# EasyEDA Pro project travellium-12v-desktop-power-supply-cc8d8467.epro, schematic MK9218_double
Board Name: MK9218_double; Create Date: 2025-01-31; Page Name: MK9218_double_SCH; Project Name: 12V桌面电源; Schematic Name: MK9218_double; Update Date: 2025-01-31; Company: 嘉立创EDA; Page Size: A4; Version: V1.0
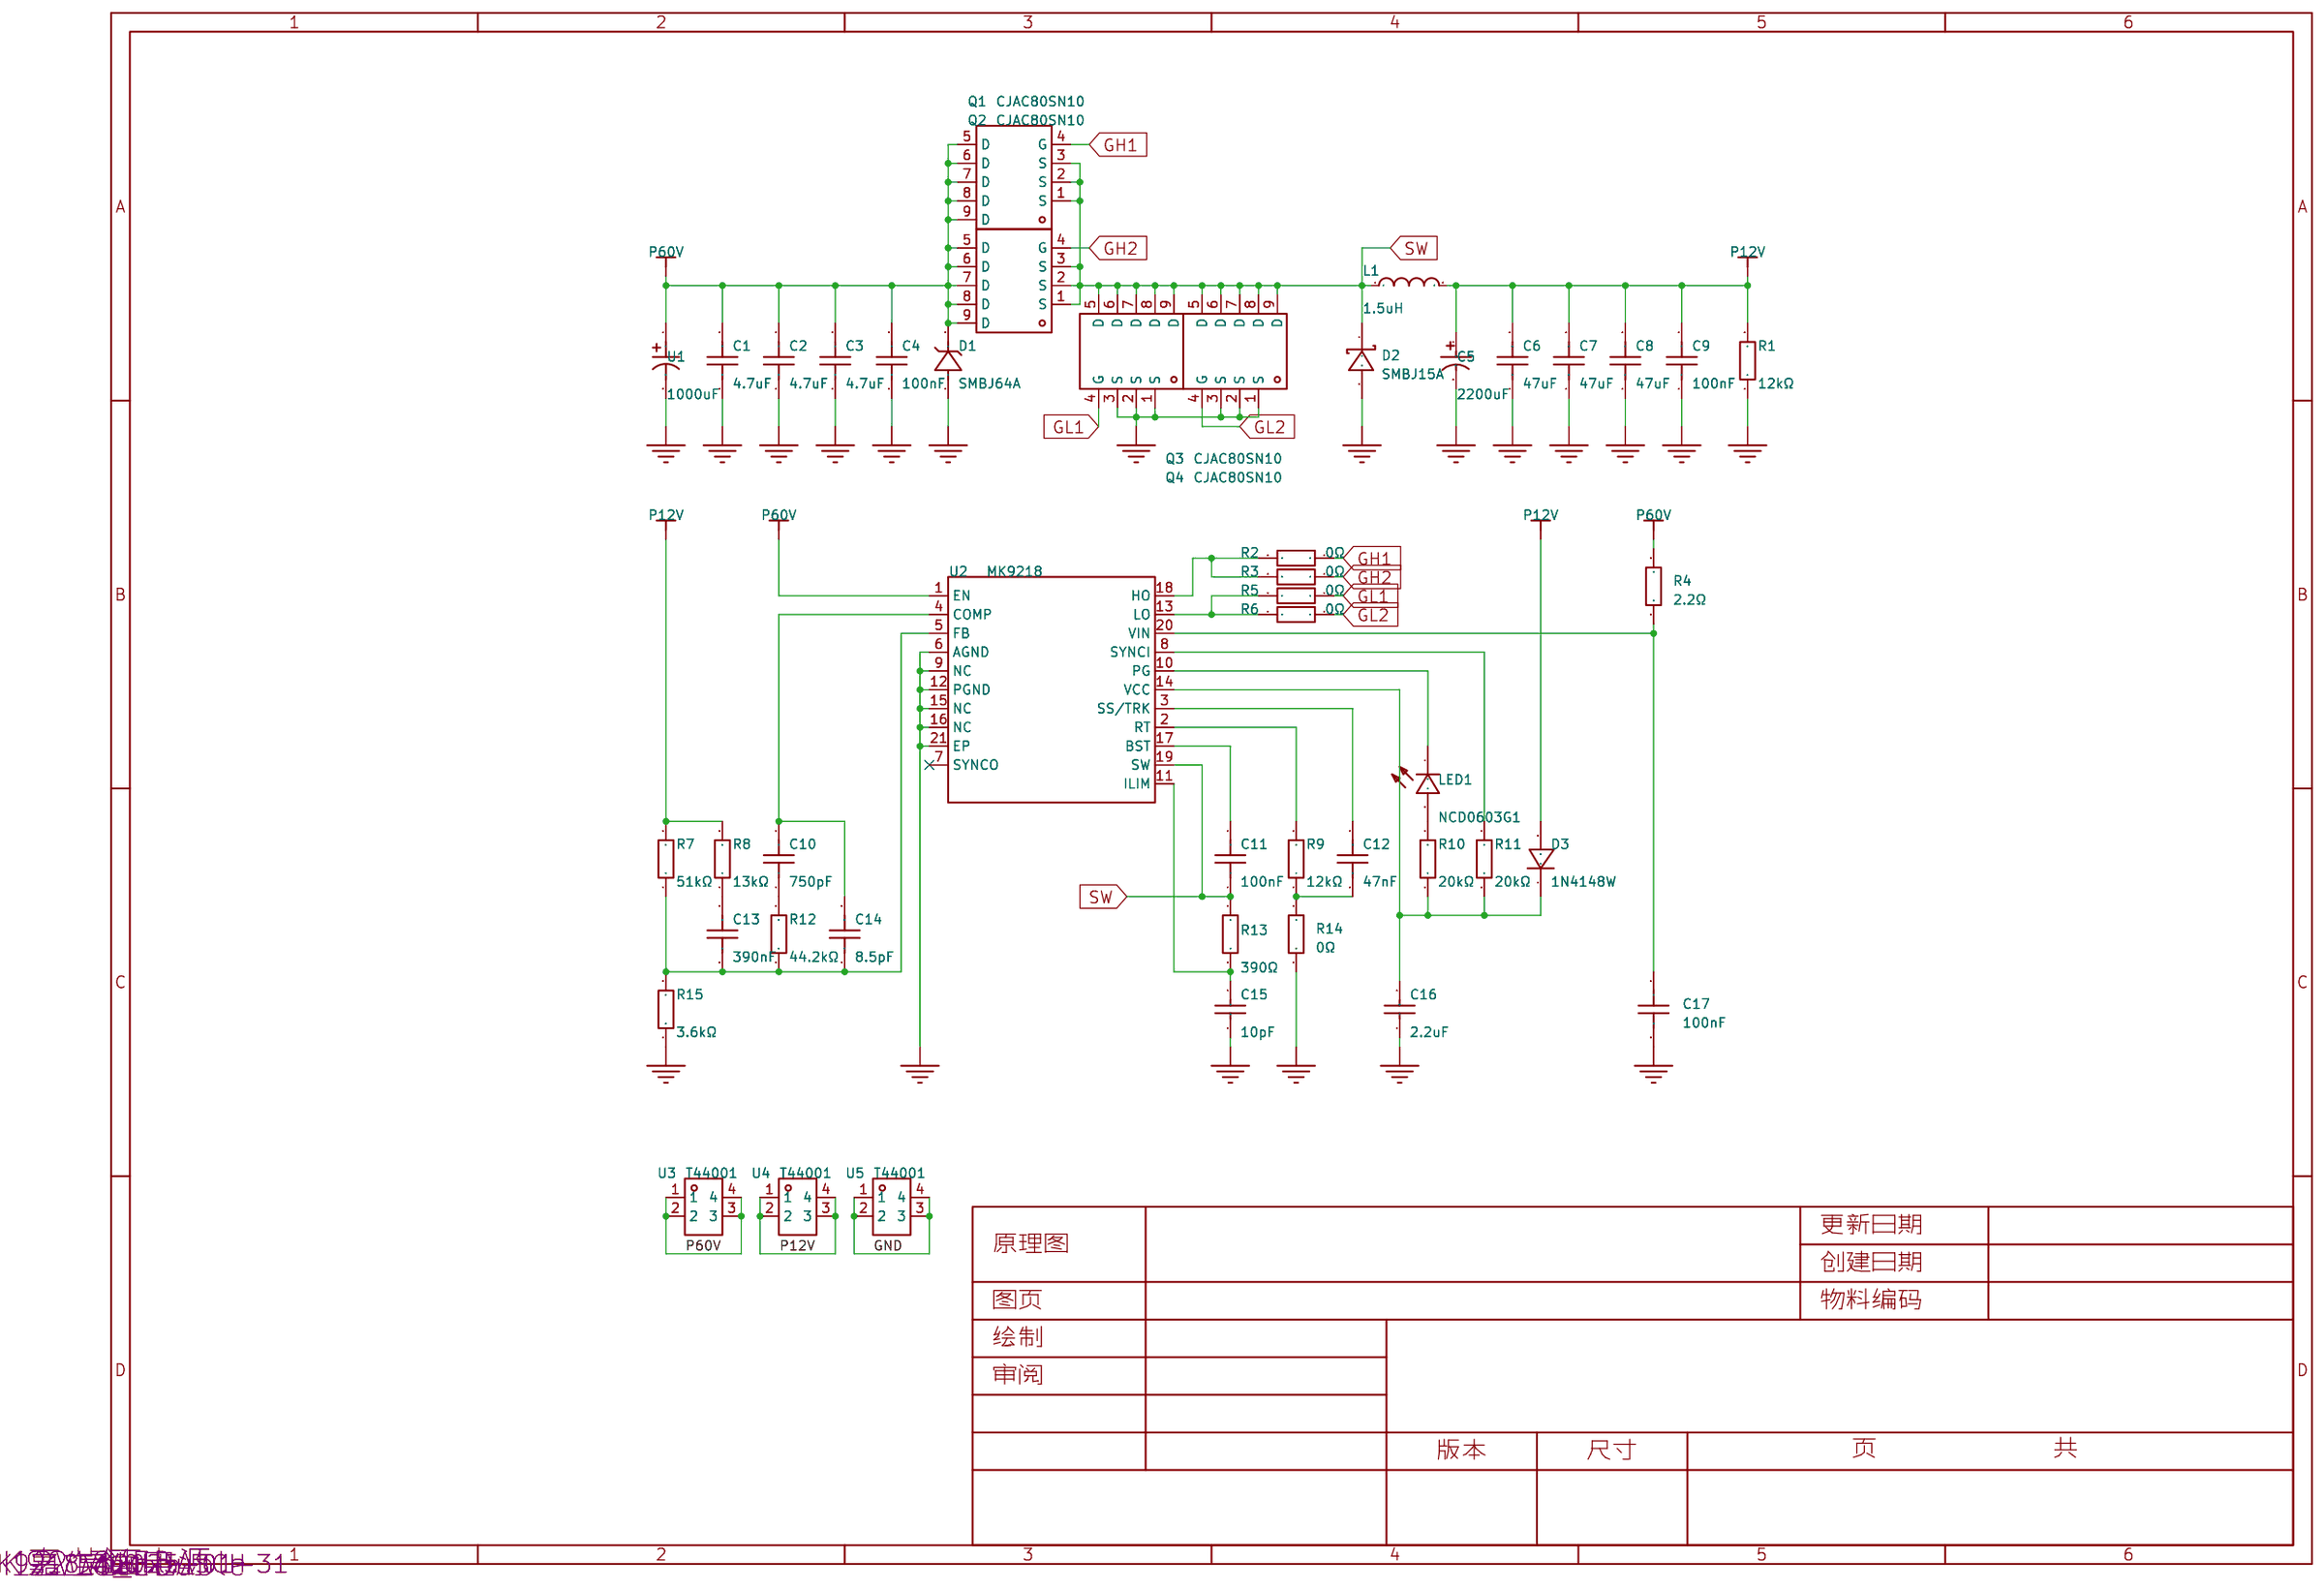
[diagram p5: schematic sheet]

## Parts
C1  4.7uF  [C1210]
C2  4.7uF  [C1210]
C3  4.7uF  [C1210]
C4  100nF  [C0603]
C5  2200uF  [CAP-TH_BD13.0-P5.00-D1.2-FD]
C6  47uF  [C1210]
C7  47uF  [C1210]
C8  47uF  [C1210]
C9  100nF  [C0603]
C10  750pF  [C0603]
C11  100nF  [C0603]
C12  47nF  [C0603]
C13  390nF  [C0603]
C14  8.5pF  [C0603]
C15  10pF  [C0603]
C16  2.2uF  [C0603]
C17  100nF  [C0603]
D1  SMBJ64A  [SMB_L4.4-W3.6-LS5.3-L-FD]
D2  SMBJ15A  [SMB_L4.6-W3.6-LS5.3-RD]
D3  1N4148W  [SOD-123_L2.8-W1.8-LS3.7-RD]
L1  1.5uH  [IND-SMD_L17.5-W17.5]
LED1  NCD0603G1  [LED0603-RD_1]
Q1  CJAC80SN10  [PDFN-8_L5.8-W5.0-P1.27-LS6.0-BL]
Q2  CJAC80SN10  [PDFN-8_L5.8-W5.0-P1.27-LS6.0-BL]
Q3  CJAC80SN10  [PDFN-8_L5.8-W5.0-P1.27-LS6.0-BL]
Q4  CJAC80SN10  [PDFN-8_L5.8-W5.0-P1.27-LS6.0-BL]
R1  12kΩ  [R0603]
R2  0Ω  [R0603]
R3  0Ω  [R0603]
R4  2.2Ω  [R0603]
R5  0Ω  [R0603]
R6  0Ω  [R0603]
R7  51kΩ  [R0603]
R8  13kΩ  [R0603]
R9  12kΩ  [R0603]
R10  20kΩ  [R0603]
R11  20kΩ  [R0603]
R12  44.2kΩ  [R0603]
R13  390Ω  [R0603]
R14  0Ω  [R0603]
R15  3.6kΩ  [R0603]
U1  1000uF  [CAP-TH_BD18.0-P7.50-D1.2-FD]
U2  MK9218  [VQFN-20_L4.5-W3.5-P0.50-BL-EP_TI_RHL0020A]  (no BOM)
U3  T44001  [CONN-TH_T44001]
U4  T44001  [CONN-TH_T44001]
U5  T44001  [CONN-TH_T44001]

## Library data of the parts
C1-C3 = 1210B475K101NT: 容值:4.7uF;精度:±10%;额定电压:100V;材质(温度系数):X7R;; LCSC Part Name: 4.7uF ±10% 100V; Supplier Part: C2840282; Manufacturer: FH(风华); Supplier Footprint: 1210; JLCPCB Part Class: 扩展库; Datasheet: https://atta.szlcsc.com/upload/public/pdf/source/20210617/C2840282_5B7AB5BFD77495008CFAB3FC2796A0E9.pdf; Supplier: LCSC; Tolerance: ±10%; Voltage Rated: 100V; Temperature Coefficient: X7R
C4 C9 C11 C17 = 0603B104K101NT: 容值:100nF;精度:±10%;额定电压:100V;材质(温度系数):X7R;; LCSC Part Name: 100nF ±10% 100V; Supplier Part: C88219; Manufacturer: FH(风华); Supplier Footprint: 0603; JLCPCB Part Class: Extended Part; Datasheet: https://atta.szlcsc.com/upload/public/pdf/source/20200305/C486355_26A10D38EF8C2A5C37091D0039909270.pdf; Supplier: LCSC; Tolerance: ±10%; Voltage Rated: 100V; Temperature Coefficient: X7R
C5 = EWH1EM222K20OT: 容值:2200uF;精度:±20%;额定电压:25V;纹波电流:-;等效串联电阻:-;; LCSC Part Name: 2200uF ±20% 25V; Supplier Part: C106733; Manufacturer: AISHI(艾华集团); Supplier Footprint: 插件,D13xL20mm; JLCPCB Part Class: 扩展库; Datasheet: https://atta.szlcsc.com/upload/public/pdf/source/20200106/C481308_16D735F9103482ADD8491C667D201AFA.pdf; Supplier: LCSC; Tolerance: ±20%; Rated Voltage: 25V; Lead Spacing: 5mm; φD: 13mm; L: 20mm; Lifetime @ Temp: 2000hrs@105℃
C6-C8 = HGC1210R5476M250NSVK: 容值:47uF;精度:±20%;额定电压:25V;材质(温度系数):X5R;; LCSC Part Name: 47uF ±20% 25V; Supplier Part: C7432791; Manufacturer: Chinocera(华瓷); Supplier Footprint: 1210; Datasheet: https://atta.szlcsc.com/upload/public/pdf/source/20240320/FAC3FEC40A78BC5CCCE96C232A94D860.pdf; Supplier: LCSC; Tolerance: ±20%; Voltage Rated: 25V; Temperature Coefficient: X5R
C10 = CC0603JRNPO9BN751: 容值:750pF;精度:±5%;额定电压:50V;材质(温度系数):NP0;; LCSC Part Name: 750pF ±5% 50V; Supplier Part: C113798; Manufacturer: YAGEO(国巨); Supplier Footprint: 0603; JLCPCB Part Class: 扩展库; Datasheet: https://atta.szlcsc.com/upload/public/pdf/source/20170914/C128857_1505359892143968080.pdf; Supplier: LCSC; Tolerance: ±5%; Voltage Rated: 50V; Temperature Coefficient: NP0
C12 = 0603B473K500NT: 容值:47nF;精度:±10%;额定电压:50V;材质(温度系数):X7R;; LCSC Part Name: 47nF ±10% 50V; Supplier Part: C285123; Manufacturer: FH(风华); Supplier Footprint: 0603; Datasheet: https://atta.szlcsc.com/upload/public/pdf/source/20200305/C486355_26A10D38EF8C2A5C37091D0039909270.pdf; Supplier: LCSC; Tolerance: ±10%; Voltage Rated: 50V; Temperature Coefficient: X7R
C13 = TCC0603X7R394K500CT: 容值:390nF;精度:±10%;额定电压:50V;材质(温度系数):X7R;; LCSC Part Name: 390nF ±10% 50V; Supplier Part: C376833; Manufacturer: CCTC(三环); Supplier Footprint: 0603; Datasheet: https://atta.szlcsc.com/upload/public/pdf/source/20191203/C466239_F62A586702D44EEA1C39B32FC8662B21.pdf; Supplier: LCSC; Tolerance: ±10%; Voltage Rated: 50V; Temperature Coefficient: X7R
C14 = 0603CG8R5C500NT: 容值:8.5pF;额定电压:50V;材质(温度系数):C0G;; LCSC Part Name: 8.5pF 50V; Supplier Part: C501848; Manufacturer: FH(风华); Supplier Footprint: 0603; Datasheet: https://atta.szlcsc.com/upload/public/pdf/source/20200305/C486355_26A10D38EF8C2A5C37091D0039909270.pdf; Supplier: LCSC; Voltage Rated: 50V; Temperature Coefficient: C0G
C15 = CC0603JRNPO9BN100: 容值:10pF;精度:±5%;额定电压:50V;材质(温度系数):NP0;; LCSC Part Name: 10pF ±5% 50V; Supplier Part: C106245; Manufacturer: YAGEO(国巨); Supplier Footprint: 0603; Datasheet: https://atta.szlcsc.com/upload/public/pdf/source/20170505/1493957838062.pdf; Supplier: LCSC; Tolerance: ±5%; Voltage Rated: 50V; Temperature Coefficient: NP0
C16 = 0603B225K250NT: 容值:2.2uF;精度:±10%;额定电压:25V;材质(温度系数):X7R;; LCSC Part Name: 2.2uF ±10% 25V; Supplier Part: C99228; Manufacturer: FH(风华); Supplier Footprint: 0603; JLCPCB Part Class: 扩展库; Datasheet: https://atta.szlcsc.com/upload/public/pdf/source/20200305/C486355_26A10D38EF8C2A5C37091D0039909270.pdf; Supplier: LCSC; Tolerance: ±10%; Voltage Rated: 25V; Temperature Coefficient: X7R
D1 = SMBJ64A_C19077594: 极性:单向;反向截止电压(Vrwm):64V;最大钳位电压:103V;峰值脉冲电流(Ipp):5.83A;峰值脉冲功率(Ppp):600W;击穿电压:78.6V;; Supplier Part: C19077594; Manufacturer: 宏迦橙; Supplier Footprint: SMB; Datasheet: https://atta.szlcsc.com/upload/public/pdf/source/20231129/482485C5E60BCB53F84D553F3B29D8A3.pdf; Supplier: LCSC; polarity: 单向; Reverse Stand-Off Voltage (Vrwm): 64V; Maximum Clamping Voltage: 103V; Peak Pulse Current (Ipp): 5.83A; Peak Pulse Power Dissipation (Ppp): 600W; Breakdown Voltage: 78.6V; Reverse Leakage Current (Ir): 5uA; Operating Temperature: -55℃~+155℃; Type: TVS
D2 = SMBJ15A_C188412: 反向截止电压(Vrwm):15V;最大钳位电压:24.4V;峰值脉冲电流(Ipp)@10/1000us:24.6A;峰值脉冲功率(Ppp)@10/1000us:600W;击穿电压:16.7V;; Supplier Part: C188412; Manufacturer: 晶导微电子; Supplier Footprint: SMB(DO-214AA); JLCPCB Part Class: 扩展库; Datasheet: https://atta.szlcsc.com/upload/public/pdf/source/20190425/C382838_2D6FAEBA99E8AAE51AD263CFC481B4D8.pdf; Supplier: LCSC; Reverse Stand-Off Voltage (Vrwm): 15V; Maximum Clamping Voltage: 24.4V; Peak Pulse Current (Ipp)@10/1000us: 24.6A; Peak Pulse Power Dissipation (Ppp)@10/1000us: 600W; Breakdown Voltage: 16.7V; Reverse Leakage Current (Ir): 1uA; Type: TVS
D3 = 1N4148W_C115103: 二极管配置:独立式;正向压降(Vf):1.25V@150mA;直流反向耐压(Vr):100V;平均整流电流(Io):300mA;功率:400mW;反向恢复时间(trr):8ns;; LCSC Part Name: 电压:100V 电流:300mA; Supplier Part: C115103; Manufacturer: 晶导微电子; Supplier Footprint: SOD-123; Datasheet: https://atta.szlcsc.com/upload/public/pdf/source/20170620/1497944800395.pdf; Supplier: LCSC; Diode Configuration: 独立式; Forward Voltage (Vf@If): 1.25V@150mA; Reverse Voltage (Vr): 100V; Average Rectified Current (Io): 300mA; Power Dissipation: 400mW; Reverse Leakage Current: 1uA@75V; Reverse Recovery Time (trr): 8ns; Operating Temperature: -55℃~+150℃@(Tj)
L1 = CKST1707-1.5uH/M: 电感值:1.5uH;精度:±20%;额定电流:35A;饱和电流(Isat):40A;类型:一体成型电感;; Manufacturer: CENKER(岑科); Supplier: LCSC; Supplier Part: C3002739; LCSC Part Name: 1.5uH ±20% 40A; Supplier Footprint: SMD,17.5x17.5mm; Datasheet: https://item.szlcsc.com/datasheet/CKST1707-1.5uH%252FM/3488246.html; Tolerance: ±20%; Rated Current: 35A; Saturation Current (Isat): 40A; DC Resistance (DCR): 2.8mΩ; Type: 一体成型电感
LED1 = NCD0603G1: 发光颜色:翠绿色;正向电压(VF):2.6V~3.6V;功率:72mW;正向电流:10mA;主波长:515nm~530nm;透镜颜色:无色透明透镜;发光强度:330mcd~900mcd;发光角度:130°;工作温度:-30℃~+85℃;; Supplier Part: C84267; Manufacturer: 国星光电; Supplier Footprint: 0603; Datasheet: https://atta.szlcsc.com/upload/public/pdf/source/20200820/C84267_04BA7703640BAC111D09F5EFB971FBF3.pdf; Supplier: LCSC; Emitted Color: 翠绿色; Forward Voltage (VF): 2.6V~3.6V; Power Dissipation: 72mW; Forward Current: 10mA; Dominant Wavelength: 515nm~530nm; Lens Color: 无色透明透镜; Luminous Intensity: 330mcd~900mcd; Viewing Angle: 130°; Operating Temperature: -30℃~+85℃
Q1-Q4 = CJAC80SN10: 类型:1个N沟道;漏源电压(Vdss):100V;连续漏极电流(Id):80A;导通电阻(RDS(on)@Vgs,Id):6.2mΩ@10V;功率:100W;阈值电压(Vgs(th)@Id):2.5V;; LCSC Part Name: 1个N沟道 耐压:100V 电流:80A; Supplier Part: C2913221; Manufacturer: CJ(江苏长电/长晶); Supplier Footprint: PDFN-8(5x6); JLCPCB Part Class: 扩展库; Datasheet: https://atta.szlcsc.com/upload/public/pdf/source/20211101/4F9ADD6ECF58ED50A240A9902BC9A3EC.pdf; Supplier: LCSC; Type: 1个N沟道; Drain Source Voltage (Vdss): 100V; Continuous Drain Current (Id): 80A; Drain Source On Resistance (RDS(on)@Vgs,Id): 6.2mΩ@10V; Power Dissipation (Pd): 100W; Gate Threshold Voltage (Vgs(th)@Id): 2.5V; Total Gate Charge (Qg@Vgs): 46nC; Input Capacitance (Ciss@Vds): 2.2nF; Reverse Transfer Capacitance (Crss@Vds): 6.3pF; Operating Temperature: -55℃~+150℃@(Tj)
R1 R9 = 0603WAF1202T5E: 电阻类型:厚膜电阻;阻值:12kΩ;精度:±1%;功率:100mW;最大工作电压:75V;温度系数:±100ppm/℃;; LCSC Part Name: 12kΩ ±1% 100mW 厚膜电阻; Supplier Part: C22790; Manufacturer: UNI-ROYAL(厚声); Supplier Footprint: 0603; Datasheet: https://atta.szlcsc.com/upload/public/pdf/source/20200306/C422600_1E6D84923E4A46A82E41ADD87F860B5C.pdf; Supplier: LCSC; Type: 厚膜电阻; Tolerance: ±1%; Power(Watts): 100mW; Overload Voltage (Max): 75V; Temperature Coefficient: ±100ppm/℃; Operating Temperature Range: -55℃~+155℃
R2 R3 R5 R6 R14 = 0603WAF0000T5E: 电阻类型:厚膜电阻;阻值:0Ω;精度:±1%;功率:100mW;最大工作电压:75V;; LCSC Part Name: 0Ω ±1% 100mW 厚膜电阻; Supplier Part: C21189; Manufacturer: UNI-ROYAL(厚声); Supplier Footprint: 0603; Datasheet: https://atta.szlcsc.com/upload/public/pdf/source/20200306/C422600_1E6D84923E4A46A82E41ADD87F860B5C.pdf; Supplier: LCSC; Type: 厚膜电阻; Tolerance: ±1%; Power(Watts): 100mW; Overload Voltage (Max): 75V; Operating Temperature Range: -55℃~+155℃
R4 = 0603WAF220KT5E: 电阻类型:厚膜电阻;阻值:2.2Ω;精度:±1%;功率:100mW;最大工作电压:75V;温度系数:±400ppm/℃;; LCSC Part Name: 2.2Ω ±1% 100mW 厚膜电阻; Supplier Part: C22939; Manufacturer: UNI-ROYAL(厚声); Supplier Footprint: 0603; Datasheet: https://atta.szlcsc.com/upload/public/pdf/source/20200306/C422600_1E6D84923E4A46A82E41ADD87F860B5C.pdf; Supplier: LCSC; Type: 厚膜电阻; Tolerance: ±1%; Power(Watts): 100mW; Overload Voltage (Max): 75V; Temperature Coefficient: ±400ppm/℃; Operating Temperature Range: -55℃~+155℃
R7 = 0603WAF5102T5E: 电阻类型:厚膜电阻;阻值:51kΩ;精度:±1%;功率:100mW;最大工作电压:75V;温度系数:±100ppm/℃;; LCSC Part Name: 51kΩ ±1% 100mW 厚膜电阻; Supplier Part: C23196; Manufacturer: UNI-ROYAL(厚声); Supplier Footprint: 0603; Datasheet: https://atta.szlcsc.com/upload/public/pdf/source/20200306/C422600_1E6D84923E4A46A82E41ADD87F860B5C.pdf; Supplier: LCSC; Type: 厚膜电阻; Tolerance: ±1%; Power(Watts): 100mW; Overload Voltage (Max): 75V; Temperature Coefficient: ±100ppm/℃; Operating Temperature Range: -55℃~+155℃
R8 = RC0603FR-0713KL: 电阻类型:厚膜电阻;阻值:13kΩ;精度:±1%;功率:100mW;最大工作电压:75V;温度系数:±100ppm/℃;; LCSC Part Name: 厚膜电阻 13kΩ ±1% 100mW; Supplier Part: C137796; Manufacturer: YAGEO(国巨); Supplier Footprint: 0603; Datasheet: https://atta.szlcsc.com/upload/public/pdf/source/20180821/C275644_0D56F95EFF785E7D9A1FEF436B37DA78.pdf; Supplier: LCSC; Type: 厚膜电阻; Tolerance: ±1%; Power(Watts): 100mW; Overload Voltage (Max): 75V; Temperature Coefficient: ±100ppm/℃; Operating Temperature Range: -55℃~+155℃
R10 R11 = 0603WAF2002T5E: 电阻类型:厚膜电阻;阻值:20kΩ;精度:±1%;功率:100mW;最大工作电压:75V;温度系数:±100ppm/℃;; LCSC Part Name: 20kΩ ±1% 100mW 厚膜电阻; Supplier Part: C4184; Manufacturer: UNI-ROYAL(厚声); Supplier Footprint: 0603; Datasheet: https://atta.szlcsc.com/upload/public/pdf/source/20200306/C422600_1E6D84923E4A46A82E41ADD87F860B5C.pdf; Supplier: LCSC; Type: 厚膜电阻; Tolerance: ±1%; Power(Watts): 100mW; Overload Voltage (Max): 75V; Temperature Coefficient: ±100ppm/℃; Operating Temperature Range: -55℃~+155℃
R12 = 0603WAF4422T5E: 电阻类型:厚膜电阻;阻值:44.2kΩ;精度:±1%;功率:100mW;最大工作电压:75V;温度系数:±100ppm/℃;; LCSC Part Name: 44.2kΩ ±1% 100mW 厚膜电阻; Supplier Part: C23056; Manufacturer: UNI-ROYAL(厚声); Supplier Footprint: 0603; Datasheet: https://atta.szlcsc.com/upload/public/pdf/source/20200306/C422600_1E6D84923E4A46A82E41ADD87F860B5C.pdf; Supplier: LCSC; Type: 厚膜电阻; Tolerance: ±1%; Power(Watts): 100mW; Overload Voltage (Max): 75V; Temperature Coefficient: ±100ppm/℃; Operating Temperature Range: -55℃~+155℃
R13 = 0603WAF3900T5E: 电阻类型:厚膜电阻;阻值:390Ω;精度:±1%;功率:100mW;最大工作电压:75V;温度系数:±100ppm/℃;; LCSC Part Name: 390Ω ±1% 100mW 厚膜电阻; Supplier Part: C23151; Manufacturer: UNI-ROYAL(厚声); Supplier Footprint: 0603; Datasheet: https://atta.szlcsc.com/upload/public/pdf/source/20200306/C422600_1E6D84923E4A46A82E41ADD87F860B5C.pdf; Supplier: LCSC; Type: 厚膜电阻; Tolerance: ±1%; Power(Watts): 100mW; Overload Voltage (Max): 75V; Temperature Coefficient: ±100ppm/℃; Operating Temperature Range: -55℃~+155℃
R15 = 0603WAF3601T5E: 电阻类型:厚膜电阻;阻值:3.6kΩ;精度:±1%;功率:100mW;最大工作电压:75V;温度系数:±100ppm/℃;; LCSC Part Name: 3.6kΩ ±1% 100mW 厚膜电阻; Supplier Part: C22980; Manufacturer: UNI-ROYAL(厚声); Supplier Footprint: 0603; JLCPCB Part Class: 基础库; Datasheet: https://atta.szlcsc.com/upload/public/pdf/source/20200306/C422600_1E6D84923E4A46A82E41ADD87F860B5C.pdf; Supplier: LCSC; Type: 厚膜电阻; Tolerance: ±1%; Power(Watts): 100mW; Overload Voltage (Max): 75V; Temperature Coefficient: ±100ppm/℃; Operating Temperature Range: -55℃~+155℃
U1 = ERS1KM102M35OT: 容值:1000uF;精度:±20%;额定电压:100V;纹波电流:-;等效串联电阻:-;; LCSC Part Name: 1000uF ±20% 100V; Supplier Part: C724666; Manufacturer: AISHI(艾华集团); Supplier Footprint: 插件,D18xL35mm; JLCPCB Part Class: 扩展库; Datasheet: https://atta.szlcsc.com/upload/public/pdf/source/20191015/C438940_4B8E60A742BB0AE40DDEF87A5C89089D.pdf; Supplier: LCSC; Tolerance: ±20%; Rated Voltage: 100V
U2 = MK9218: Supplier Part: C9900058707; Supplier Footprint: QFN20L; Supplier: LCSC
U3-U5 = T44001: LCSC Part Name: 四脚 M4 二件套; Supplier Part: C481447; Manufacturer: XFCN(兴飞); Supplier Footprint: 插件; Datasheet: https://atta.szlcsc.com/upload/public/pdf/source/20200107/C481448_4214B4EB74A46B70BD82BA8A456D4EDD.pdf; Supplier: LCSC

## Nets
GND: C1.1 C2.1 C3.1 C4.1 C5.2 C6.1 C7.1 C8.1 C9.1 C15.1 C16.1 C17.2 D1.1(A) D2.2(A) Q3.1(S) Q3.2(S) Q3.3(S) Q4.1(S) Q4.2(S) Q4.3(S) R1.1 R14.1 R15.1 U1.2 U2.6(AGND) U2.9(NC) U2.12(PGND) U2.15(NC) U2.16(NC) U2.21(EP) U5.1 U5.2 U5.3 U5.4
P12V: C5.1 C6.2 C7.2 C8.2 C9.2 D3.2(A) L1.2 R1.2 R7.2 R8.2 U4.1 U4.2 U4.3 U4.4
P60V: C1.2 C2.2 C3.2 C4.2 D1.2(K) Q1.5(D) Q1.6(D) Q1.7(D) Q1.8(D) Q1.9(D) Q2.5(D) Q2.6(D) Q2.7(D) Q2.8(D) Q2.9(D) R4.2 U1.1 U2.1(EN) U3.1 U3.2 U3.3 U3.4
GH1: Q1.4(G) R2.1
GH2: Q2.4(G) R3.1
GL1: Q3.4(G) R5.1
GL2: Q4.4(G) R6.1
SW: C11.1 D2.1(K) L1.1 Q1.1(S) Q1.2(S) Q1.3(S) Q2.1(S) Q2.2(S) Q2.3(S) Q3.5(D) Q3.6(D) Q3.7(D) Q3.8(D) Q3.9(D) Q4.5(D) Q4.6(D) Q4.7(D) Q4.8(D) Q4.9(D) R13.1 U2.19(SW)
$1N5923: C13.1 R8.1
$1N5928: C13.2 C14.1 R7.1 R12.1 R15.2 U2.5(FB)
$1N31770: C12.2 R9.1 R14.2
$1N31791: C12.1 U2.3(SS/TRK)
$1N31948: C17.1 R4.1 U2.20(VIN)
$1N32058: C16.2 D3.1(K) R10.2 R11.2 U2.14(VCC)
$1N32091: R11.1 U2.8(SYNCI)
$1N32186: LED1.2(A) R10.1
$1N32326: R5.2 R6.2 U2.13(LO)
$1N32622: C11.2 U2.17(BST)
$1N32707: R2.2 R3.2 U2.18(HO)
$1N32717: C15.2 R13.2 U2.11(ILIM)
$1N34967: LED1.1(K) U2.10(PG)
$1N37231: R9.2 U2.2(RT)
$1N38925: C10.1 R12.2
$1N38932: C10.2 C14.2 U2.4(COMP)

Not connected (* = marked no-connect by the designer): U2 7(SYNCO)*
